# Altium schematic sheet Board3ph.SchDoc (part 2 of 2)
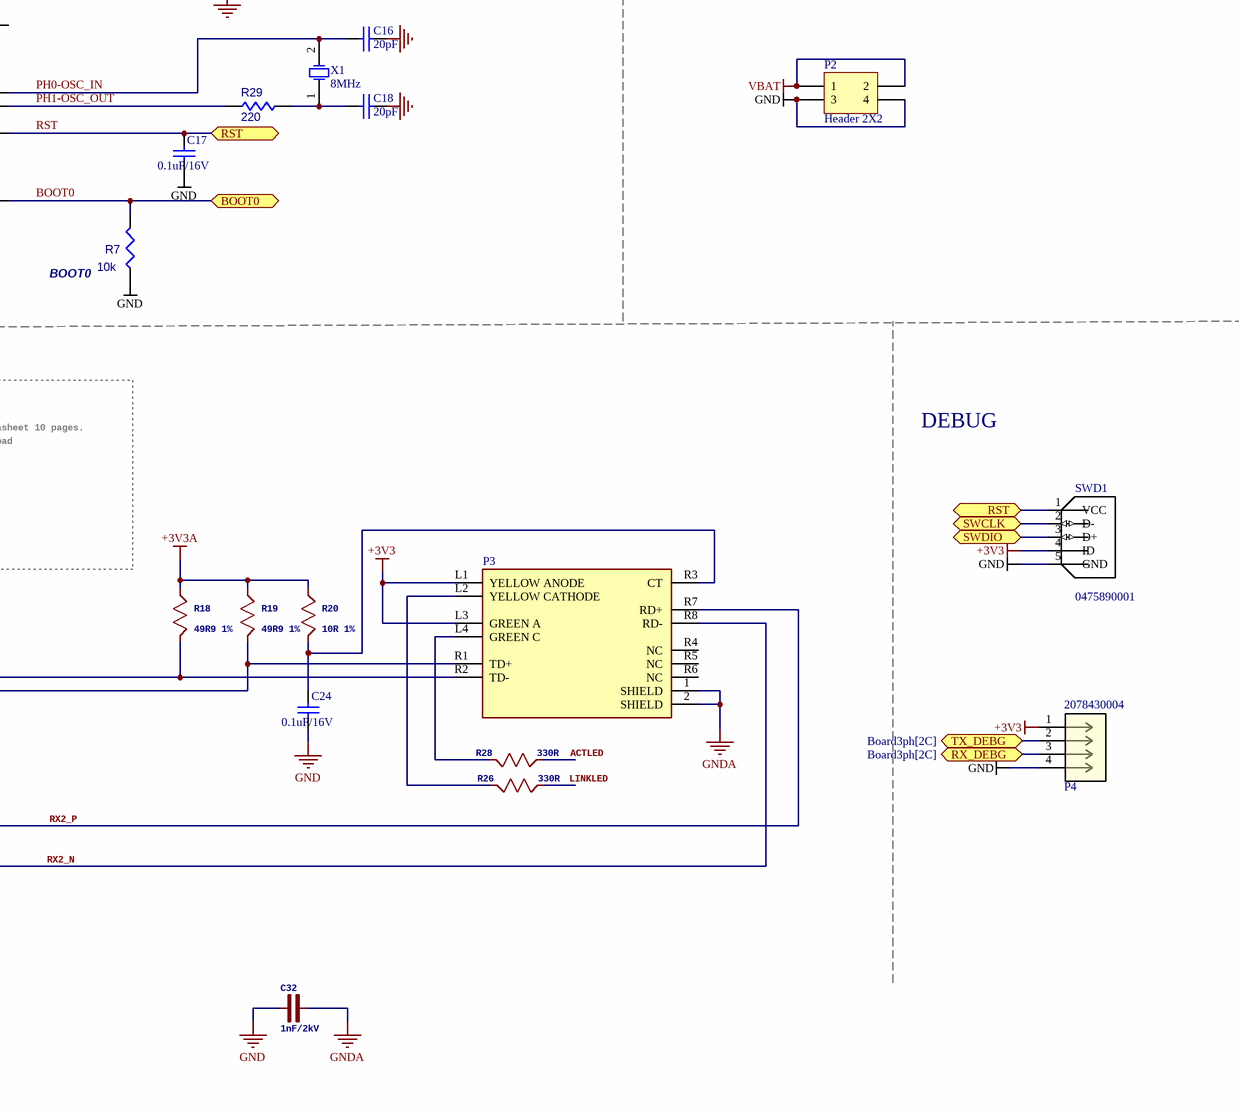
[diagram p4: Board3ph.SchDoc, bottom right]

## Library data of the parts
C1 = TAJC686K016RNJ: CAP TANT 68UF 10% 16V 2312; Manufacturer: Kyocera AVX; Item Type: Capacitors; Dielectric Material: Tantalum; ESR (Equivalent Series Resistance): 1.3R; Voltage Rating (DC): 16.3V; Leakage Current: 10.9uA; Polarity: Polar; Dissipation Factor: 6%; Supplier: Digikey; LCSC Part Number: C7220; Manufacturer Part Number: TAJC686K016RNJ; RoHS: Yes; Stock: 888; Pricing: 1=1.06, 10=0.729, 50=0.581, 100=0.5317 (USD); Mounting Technology: Surface Mount; Case/Package: Molded; Pins: 2; Case Code (Imperial): 2312; Case Code (Metric): 6032; Min Operating Temperature: -55°C; Max Operating Temperature: 125°C; Value: 68uF; Tolerance: 10%; Packaging: Tape and Reel; Voltage Rating: 16V; Package Quantity: 1; Termination: SMD/SMT; Voltage: 16V; Features: General Purpose; Series: TAJ; Length: 6mm; Width: 3.2mm; Height: 2.6mm; Height - Seated (Max): 0.11inch; Depth: 3.2mm; Radiation Hardening: No; Reach SVHC Compliant: No; Lead Free: Lead Free; RoHS Compliant: Yes; ComponentLink1URL: https://datasheet.ciiva.com/11794/0900766b802e69d0-11794413.pdf?src-supplier=Rs; ComponentLink1Description: https://datasheet.ciiva.com/11794/0900766b802e69d0-11794413.pdf?src-supplier=Rs; ComponentLink2URL: https://datasheet.ciiva.com/7864/1680476-7864538.pdf?src-supplier=Element14; ComponentLink2Description: https://datasheet.ciiva.com/7864/1680476-7864538.pdf?src-supplier=Element14; ComponentLink3URL: https://datasheet.ciiva.com/7864/1680476-7864539.pdf?src-supplier=Element14; ComponentLink3Description: https://datasheet.ciiva.com/7864/1680476-7864539.pdf?src-supplier=Element14; ComponentLink4URL: https://datasheet.ciiva.com/7864/1680476-7864537.pdf?src-supplier=Element14; ComponentLink4Description: https://datasheet.ciiva.com/7864/1680476-7864537.pdf?src-supplier=Element14; ComponentLink5URL: https://datasheet.ciiva.com/28577/taj-28577855.pdf?src-supplier=Element14; ComponentLink5Description: https://datasheet.ciiva.com/28577/taj-28577855.pdf?src-supplier=Element14; ComponentLink6URL: https://datasheet.ciiva.com/264/taj-264443.pdf?src-supplier=Digikey; ComponentLink6Description: https://datasheet.ciiva.com/264/taj-264443.pdf?src-supplier=Digikey; ComponentLink7URL: https://datasheet.ciiva.com/264/taj-264442.pdf?src-supplier=Digikey; ComponentLink7Description: https://datasheet.ciiva.com/264/taj-264442.pdf?src-supplier=Digikey; ComponentLink8URL: https://datasheet.ciiva.com/264/taj-264444.pdf?src-supplier=Digikey; ComponentLink8Description: https://datasheet.ciiva.com/264/taj-264444.pdf?src-supplier=Digikey; ComponentLink9URL: https://datasheet.ciiva.com/12883/taj-27497-12883640.pdf?src-supplier=Mouser; ComponentLink9Description: https://datasheet.ciiva.com/12883/taj-27497-12883640.pdf?src-supplier=Mouser; ComponentLink10URL: https://datasheet.ciiva.com/11225/taj-11225965.pdf?src-supplier=Avnet; ComponentLink10Description: https://datasheet.ciiva.com/11225/taj-11225965.pdf?src-supplier=Avnet; ComponentLink11URL: https://datasheet.ciiva.com/16298/taj-16298458.pdf?src-supplier=Future+Electronics; ComponentLink11Description: https://datasheet.ciiva.com/16298/taj-16298458.pdf?src-supplier=Future+Electronics; ComponentLink12URL: https://datasheet.ciiva.com/15163/getdatasheetpartid-41779-15163003.pdf?src-supplier=Verical; ComponentLink12Description: https://datasheet.ciiva.com/15163/getdatasheetpartid-41779-15163003.pdf?src-supplier=Verical
C2 C6-C9 C11 C14 C17 C19-C24 = Cap: CAPACITOR 0603 CERAMIC; Manufacturer: Samsung; Manufacturer Part Number: CL10F104ZO8NNNC; Value: 100nF; Voltage Rating: 16V; Revision: July-2002: Re-released for DXP Platform.; Supplier 1: Digi-Key; Supplier Part Number 1: 1276-1258-1-ND; Capacitance: 100nF; Case Code (Metric): 1608; Category: Ceramic Capacitors
C3 C4 = C-3216(TANTAL): CAP TANT 10UF 10% 10V 1206  (3216); Manufacturer: Kyocera AVX; Manufacturer Part Number: TAJA106K006RNJ; Tolerance: 20%; Voltage: 6.3V; ComponentLink1Description: supplier; ComponentLink1URL: https://www.digikey.com/product-detail/en/avx-corporation/TAJA106K010RNJ/478-1654-1-ND/564686; Supplier 1: Digi-Key; Supplier Part Number 1: 478-1653-1-ND; Capacitance: 10uF; Case Code (Metric): 3216; Category: Tantalum Capacitors
C5 = Cap Pol1: Polarized Capacitor  1uF/16V TANTAL 0805; Manufacturer: Kyocera AVX; Manufacturer Part Number: F921C105MPA; Value: 1uF; Tolerance: 20%; Voltage Rating: 16V; Published: 8-Jun-2000; Revision: July-2002: Re-released for DXP Platform.; Publisher: Altium Limited; Supplier 1: Digi-Key; Supplier Part Number 1: 478-8126-1-ND; Case Code (Metric): 2012; Category: Tantalum Capacitors; Supplier Unit Price 1: $0.09899
C10 C38 = CAP: Capacitor 1uF 6.3V X5R 10% SMD 0603; Manufacturer: Samsung; Manufacturer Part Number: CL10A105KQ8NNNC; Value: 1uF; Supplier 1: Digi-Key; Supplier Part Number 1: 1276-1036-1-ND; Case Code (Metric): 1608; Category: Ceramic Capacitors; Dielectric: X5R; Tolerance: 10%; Voltage Rating: 6.3V; Supplier Unit Price 1: $0.00877
C12 C13 = 0805C-18PF-50V-C0G-JOH: Tantalum Capacitors - Solid SMD 10V 22uF 20%  3216 -1206; Manufacturer: Kyocera AVX; Manufacturer Part Number: TAJA226M010RNJ; Leakage Current: 2.2uA; Supplier 1: Digi-Key; Supplier Part Number 1: 478-5798-1-ND; Case Code (Metric): 3216; Category: Tantalum Capacitors
C15 C43 C44 C46 = CL10F104ZO8NNNC: Multilayer Ceramic Capacitor, 0.1 uF, 16 V, -20, +80%, Y5V, 0603 [1608 Metric]; Manufacturer: Samsung; Material: 4241ConductorMaterial; Voltage Rating (DC): 16V; Supplier: Digikey; Supplier Part Number: 1276-1258-1-ND; Manufacturer Part Number: CL10F104ZO8NNNC; RoHS: Yes; Category: Ceramic Capacitors; Stock: 2033375; Pricing: 1=0.1, 10=0.027, 50=0.018, 100=0.0153, 500=0.01076, 1000=0.00938 (USD); ComponentLink1URL: https://datasheet.ciiva.com/16199/cl10f104zo8nnnc-16199254.pdf?src-supplier=Future+Electronics; ComponentLink1Description: https://datasheet.ciiva.com/16199/cl10f104zo8nnnc-16199254.pdf?src-supplier=Future+Electronics; ComponentLink2URL: https://datasheet.ciiva.com/25805/cl10f104zo8nnnc-25805810.pdf?src-supplier=Digikey; ComponentLink2Description: https://datasheet.ciiva.com/25805/cl10f104zo8nnnc-25805810.pdf?src-supplier=Digikey; LCSC Part Number: C2762283
C16 C18 = CAP: Capacitor 20p 50v 0603; Manufacturer: Samsung; Manufacturer Part Number: CL10C200JB8NNNC; Temperature Coefficient: 300ppm/°C; Tolerance: 5%; Value: 20pF; Supplier 1: Digi-Key; Supplier Part Number 1: 1276-1187-1-ND; Capacitance: 20pF; Case Code (Metric): 1608; Category: Ceramic Capacitors; Voltage: 50V; Supplier Unit Price 1: $0.0134
C25 C37 = C-3216(TANTAL): CAP TANT 10UF 10% 10V 1206  (3216); Manufacturer: Kyocera AVX; Manufacturer Part Number: TAJA106K010RNJ; ESR (Equivalent Series Resistance): 3R; ComponentLink1Description: supplier; ComponentLink1URL: https://www.digikey.com/product-detail/en/avx-corporation/TAJA106K010RNJ/478-1654-1-ND/564686; Supplier 1: Digi-Key; Supplier Part Number 1: 478-1654-1-ND; Capacitance: 10uF; Case Code (Metric): 3216; Category: Tantalum Capacitors; Tolerance: 10%; Voltage: 10V
C26 C31 C34 = C-1608: Multilayer Ceramic Capacitors MLCC - SMD/SMT 16V 0.01uF 0603 X8R 5%; Manufacturer: KEMET; Manufacturer Part Number: C0603X103J4HACTU; Supplier 1: Mouser; Supplier Part Number 1: 80-C0603X103J4HACTU; Supplier Unit Price 1: $0.024
C27 C30 = C-1608: 6800pF ±10% 200V Ceramic Capacitor X7R 0603 (1608 Metric); Manufacturer: KEMET; Manufacturer Part Number: C0603C682K2RECAUTO; Capacitance: 6.8nF; Supplier 1: Digi-Key; Supplier Part Number 1: 399-14765-1-ND; Case Code (Metric): 1608; Category: Ceramic Capacitors; Tolerance: 10%; Supplier Unit Price 1: $0.05209
C28 C29 = C-1608: 18pF ±5% 50V Ceramic Capacitor C0G, NP0 0603 (1608 Metric); Manufacturer: Samsung; Manufacturer Part Number: CL10C180JB8NNNC; Temperature Coefficient: 300ppm/°C; Supplier 1: Digi-Key; Supplier Part Number 1: 1276-1089-1-ND; Capacitance: 18pF; Case Code (Metric): 1608; Category: Ceramic Capacitors; Mount: Surface Mount; Tolerance: 5%; Supplier Unit Price 1: $0.01549
C32 = C-4520: 1000pF ±10% 1000V (1kV) Ceramic Capacitor X7R 0805 (2012 Metric); Manufacturer: KEMET; Manufacturer Part Number: C0805C102KDRACAUTO; Capacitance: 1nF; Supplier 1: Digi-Key; Supplier Part Number 1: 399-16643-1-ND; Case/Package: 0805; Category: Capacitors; Tolerance: 10%; Voltage Rating: 1kV; Supplier Unit Price 1: $0.13364
C33 = C-2012: CAP CER 4,7UF 10V X5R 0603; Tolerance: 10%; Voltage Rating: 25V; Capacitance: 4.7uF; Case Code (Imperial): 0603; Category: Ceramic Capacitors; Dielectric: X5R; Supplier Unit Price 1: $0.05773
C35 C36 = 0603C: CAPACITOR 0603 CERAMIC  9p 50V; Manufacturer Part Number: CGA3E2NP01H090D080AA; Manufacturer: TDK; Capacitance: 9pF; Dielectric: C0G; Case Code (Imperial): 0603; Case Code (Metric): 1608; Category: Ceramic Capacitors; Features: High Temperature; Resistor Type: Ceramic; Ratings: AEC-Q200; Supplier 1: Digi-Key; Supplier Part Number 1: 445-12433-1-ND; Supplier Unit Price 1: $0.20
C39 C47 = TAJA106K010RNJ: CAP TANT 10UF 10% 10V 1206; Manufacturer: Kyocera AVX; Dielectric Material: 5684ConductorMaterial; Life (Hours): 2000Hour; Ripple Current: 158mA; Q Factor: 6NUMBER; Supplier: Digikey; Supplier Part Number: 478-1654-1-ND; Manufacturer Part Number: TAJA106K010RNJ; RoHS: Yes; Category: Tantalum Capacitors; Stock: 171123; Pricing: 1=0.37, 10=0.219, 50=0.158, 100=0.139, 500=0.10666, 1000=0.09657 (USD); Voltage Rating (AC): 10V; Lead Free: 5697LeadFree; ComponentLink1URL: https://datasheet.ciiva.com/11793/0900766b80ccdc61-11793042.pdf?src-supplier=Rs; ComponentLink1Description: https://datasheet.ciiva.com/11793/0900766b80ccdc61-11793042.pdf?src-supplier=Rs; ComponentLink2URL: https://datasheet.ciiva.com/7730/1826076-7730709.pdf?src-supplier=Element14; ComponentLink2Description: https://datasheet.ciiva.com/7730/1826076-7730709.pdf?src-supplier=Element14; ComponentLink3URL: https://datasheet.ciiva.com/7730/1703059-7730710.pdf?src-supplier=Element14; ComponentLink3Description: https://datasheet.ciiva.com/7730/1703059-7730710.pdf?src-supplier=Element14; ComponentLink4URL: https://datasheet.ciiva.com/7730/1826076-7730711.pdf?src-supplier=Element14; ComponentLink4Description: https://datasheet.ciiva.com/7730/1826076-7730711.pdf?src-supplier=Element14; ComponentLink5URL: https://datasheet.ciiva.com/14593/70001050-14593951.pdf?src-supplier=Allied+Electronics; ComponentLink5Description: https://datasheet.ciiva.com/14593/70001050-14593951.pdf?src-supplier=Allied+Electronics; ComponentLink6URL: https://datasheet.ciiva.com/3004/taj-3004385.pdf?src-supplier=Avnet; ComponentLink6Description: https://datasheet.ciiva.com/3004/taj-3004385.pdf?src-supplier=Avnet; ComponentLink7URL: https://datasheet.ciiva.com/3004/taj-3004386.pdf?src-supplier=Avnet; ComponentLink7Description: https://datasheet.ciiva.com/3004/taj-3004386.pdf?src-supplier=Avnet; ComponentLink8URL: https://datasheet.ciiva.com/5936/2613-5936824.pdf?src-supplier=Farnell; ComponentLink8Description: https://datasheet.ciiva.com/5936/2613-5936824.pdf?src-supplier=Farnell; ComponentLink9URL: https://datasheet.ciiva.com/12882/taj-27497-12882583.pdf?src-supplier=Mouser; ComponentLink9Description: https://datasheet.ciiva.com/12882/taj-27497-12882583.pdf?src-supplier=Mouser; ComponentLink10URL: https://datasheet.ciiva.com/263/taj-263394.pdf?src-supplier=Digikey; ComponentLink10Description: https://datasheet.ciiva.com/263/taj-263394.pdf?src-supplier=Digikey; ComponentLink11URL: https://datasheet.ciiva.com/263/taj-263395.pdf?src-supplier=Digikey; ComponentLink11Description: https://datasheet.ciiva.com/263/taj-263395.pdf?src-supplier=Digikey; ComponentLink12URL: https://datasheet.ciiva.com/263/taj-263396.pdf?src-supplier=Digikey; ComponentLink12Description: https://datasheet.ciiva.com/263/taj-263396.pdf?src-supplier=Digikey; LCSC Part No:: C7177
C40 = EMK212B7225KGHT: CAP CER 2.2UF 16V X7R 0805; Manufacturer: Taiyo Yuden; Item Type: Capacitors; Material: 4241ConductorMaterial; Supplier: Digikey; LCSC Part Number: C385899; Manufacturer Part Number: EMK212B7225KGHT; RoHS: Yes; Stock: 8236; Pricing: 1=0.24, 10=0.137, 50=0.097, 100=0.0847, 500=0.06374, 1000=0.05721 (USD); Lead Free: 5697LeadFree; Halogen Free: 5694HalogenFree; ComponentLink1URL: http://www.mouser.com/ds/2/396/mlcc11_hq_e-541564.pdf?src-supplier=Mouser; ComponentLink1Description: http://www.mouser.com/ds/2/396/mlcc11_hq_e-541564.pdf?src-supplier=Mouser; ComponentLink2URL: https://datasheet.octopart.com/EMK212B7225KGHT-Taiyo-Yuden-datasheet-152732874.pdf?src-supplier=Newark; ComponentLink2Description: https://datasheet.octopart.com/EMK212B7225KGHT-Taiyo-Yuden-datasheet-152732874.pdf?src-supplier=Newark; ComponentLink3URL: https://datasheet.octopart.com/EMK212B7225KGHT-Taiyo-Yuden-datasheet-97186030.pdf?src-supplier=Future+Electronics; ComponentLink3Description: https://datasheet.octopart.com/EMK212B7225KGHT-Taiyo-Yuden-datasheet-97186030.pdf?src-supplier=Future+Electronics; ComponentLink4URL: https://ds.yuden.co.jp/TYCOMPAS/ut/detail?pn=EMK212B7225KGHT  &amp;u=M&src-supplier=Digikey; ComponentLink4Description: https://ds.yuden.co.jp/TYCOMPAS/ut/detail?pn=EMK212B7225KGHT  &amp;u=M&src-supplier=Digikey; ComponentLink5URL: http://www.yuden.co.jp/productdata/catalog/en/mlcc01_hq_e.pdf?src-supplier=Digikey; ComponentLink5Description: http://www.yuden.co.jp/productdata/catalog/en/mlcc01_hq_e.pdf?src-supplier=Digikey; ComponentLink6URL: http://www.yuden.co.jp/ut/product/category/capacitor/putpdf/EMK212B7225KGHT.pdf?src-supplier=Avnet; ComponentLink6Description: http://www.yuden.co.jp/ut/product/category/capacitor/putpdf/EMK212B7225KGHT.pdf?src-supplier=Avnet; ComponentLink7URL: https://datasheet.octopart.com/EMK212B7225KGHT-Taiyo-Yuden-datasheet-154808297.pdf?src-supplier=Master+Electronics; ComponentLink7Description: https://datasheet.octopart.com/EMK212B7225KGHT-Taiyo-Yuden-datasheet-154808297.pdf?src-supplier=Master+Electronics
C41 C42 = EMK325ABJ107MM-P: CAP CER 100UF 16V X5R 1210; Manufacturer: Taiyo Yuden; Tolerance: 20%; Item Type: Capacitor; Supplier 1: Digi-Key; Manufacturer Part Number: EMK325ABJ107MM-P; RoHS: Yes; Category: Ceramic Capacitors; Stock 1: 81344; Pricing 1: 1=1.75, 10=1.415, 50=1.2352, 100=1.0809, 500=0.82352 (USD); Mounting Technology: Surface Mount; Case/Package: 1210; Case Code (Imperial): 1210; Case Code (Metric): 3225; Min Operating Temperature: -55°C; Max Operating Temperature: 85°C; Packaging: Cut Tape; Value: 100uF; Voltage Rating: 16V; Series: M; Lead Free: Lead Free; RoHS Compliant: Yes; ComponentLink1URL: http://ds.yuden.co.jp/TYCOMPAS/ut/detail.do?productNo=EMK325ABJ107MM-P&fileName=EMK325ABJ107MM-P_SS&mode=specSheetDownload&src-supplier=Digi-Key; ComponentLink1Description: http://ds.yuden.co.jp/TYCOMPAS/ut/detail.do?productNo=EMK325ABJ107MM-P&fileName=EMK325ABJ107MM-P_SS&mode=specSheetDownload&src-supplier=Digi-Key; Supplier Part Number 1: 587-5426-1-ND; LCSC Part Number: C90143
C45 C49 = DGH256Q2R7: CAPACITOR 25F -10%, +30% 2.7V TH; Manufacturer: CDE Illinois Capacitor; Supplier: Arrow Electronics; Supplier Part Number: DGH256Q2R7; Manufacturer Part Number: DGH256Q2R7; RoHS: Yes; Item Type: Capacitor; Pricing: 100=3.433, 4500=1.646 (USD); ComponentLink1URL: https://www.cde.com/resources/catalogs/DGH-series.pdf?src-supplier=Digikey; ComponentLink1Description: https://www.cde.com/resources/catalogs/DGH-series.pdf?src-supplier=Digikey
C48 = CC0402KRX7R8BB102: CAP CER 1000PF 25V X7R 0402; Manufacturer: Yageo; Tolerance: 10%; Dissipation Factor: 2.5%; Insulation Resistance: 10GR; Item Type: Capacitor; Supplier 1: Arrow Electronics; Manufacturer Part Number: CC0402KRX7R8BB102; RoHS: Yes; Category: Ceramic Capacitors; Stock 1: 370000; Pricing 1: 1=0.00230, 10000=0.00230, 100001=0.00190 (USD); Mount: Surface Mount; Case/Package: 0402; Number of Pins: 2; Case Code (Imperial): 0402; Case Code (Metric): 1005; Min Operating Temperature: -55°C; Max Operating Temperature: 125°C; Capacitance: 1nF; Packaging: Tape and Reel; Voltage Rating: 25V; Dielectric: X7R; Termination: SMD/SMT; Voltage Rating (DC): 25V; Series: CC; Length: 1mm; Width: 0.02inch; Thickness: 0.022inch; Depth: 0.5mm; Radiation Hardening: No; Lead Free: Lead Free; Halogen Free: Halogen Free; RoHS Compliant: Yes; ComponentLink1URL: https://datasheet.ciiva.com/26862/getdatasheetpartid-639817-26862638.pdf?src-supplier=Verical; ComponentLink1Description: https://datasheet.ciiva.com/26862/getdatasheetpartid-639817-26862638.pdf?src-supplier=Verical; ComponentLink2URL: https://datasheet.ciiva.com/5425/upy-gp-np0-16v-to-50v-8-3714-5425527.pdf?src-supplier=Mouser; ComponentLink2Description: https://datasheet.ciiva.com/5425/upy-gp-np0-16v-to-50v-8-3714-5425527.pdf?src-supplier=Mouser; Supplier Part Number 1: CC0402KRX7R8BB102; LCSC Part Number: C541372
J1 J3 = SFMC-102-X1-XX-D: Socket Strip, Cuttable, Double Row, 0.050"x0.050" Pitch; MANUFACTURER: SAMTEC; PCB DECAL: SFMC-104-X1-XX-D; System: Connector; CREATED: JUNE 03,  2014 - WENDY XIN
J2 = SFMC-104-X1-XX-D: Socket Strip, Cuttable, Double Row, 0.050"x0.050" Pitch; MANUFACTURER: SAMTEC; System: Connector; CREATED: JUNE 03,  2014 - WENDY XIN; PCB DECAL: SFMC-104-X1-XX-D
L1 = L-1608: FIXED IND 1.5UH 625MA 150 MOHM; Manufacturer: TDK; Shielding: Shielded; Tolerance: 20%; Supplier 1: Digi-Key; Supplier Part Number 1: 445-6152-1-ND; Case Code (Metric): 1608; Category: Fixed Inductors; Composition: Wirewound; Current Rating: 625mA; Manufacturer Part Number: GLFR1608T1R5M-LR; Termination: SMD/SMT; Supplier Unit Price 1: $0.10971
L2 = Inductor: FERRITE BEAD 30 OHM 0603 1LN; Manufacturer: TDK; Manufacturer Part Number: MPZ1608S300ATAH0; Impedance: 30R; Tolerance: 25%; Test Frequency: 100MHz; Supplier 1: Digi-Key; Supplier Part Number 1: 445-1562-1-ND; Case Code (Metric): 1608; Category: Ferrite Beads and Chips
L3 = MS0650-2R2M-C: 9.5A 2.2uH ±20% 16A SMD,7.15x6.6x5mm Power Inductors ROHS; Manufacturer: COILMX; Manufacturer Part Number: MS0650-2R2M-C; Package: SMD,7.15x6.6x5mm; LCSC Part Number: C18199494; Item Type: Inductor; ComponentLink1Description: LCSC; ComponentLink1URL: https://www.lcsc.com/product-detail/Power-Inductors_COILMX-MS0650-2R2M-C_C18199494.html
LED1 = LED-1608: LED RED CLEAR 2SMD 1.95V, 5mA; Manufacturer Part Number: 19-217/R6C-AL1M2VY/3T; Manufacturer: Everlight; Forward Voltage: 2.2V; Supplier 1: Digi-Key; Supplier Part Number 1: 1080-1585-1-ND; Case/Package: 0603; ComponentLink1URL: https://media.digikey.com/pdf/Data%20Sheets/Everlight%20PDFs/19-217-R6C-AL1M2VY-3T.pdf?src-supplier=Digi-Key; ComponentLink1Description: https://media.digikey.com/pdf/Data%20Sheets/Everlight%20PDFs/19-217-R6C-AL1M2VY-3T.pdf?src-supplier=Digi-Key
LED2 LED3 = NCD0603Y2: yellow 0603 Light Emitting Diodes (LED) ROHS; Manufacturer: Foshan NationStar Optoelectronics; Manufacturer Part Number: NCD0603Y2; Package: 0603; LCSC Part Number: C89811; Item Type: LED; ComponentLink1Description: LCSC; ComponentLink1URL: https://www.lcsc.com/product-detail/Light-Emitting-Diodes-LED_Foshan-NationStar-Optoelectronics-NCD0603Y2_C89811.html
LED4 = NCD0603R3: RED LED 0603 Light Emitting Diodes; Manufacturer: Foshan NationStar Optoelectronics; Manufacturer Part Number: NCD0603R3; Package: 0603; Item Type: LED; LCSC Part Number: C3151730; ComponentLink1Description: LCSC; ComponentLink1URL: https://www.lcsc.com/product-detail/Light-Emitting-Diodes-LED_Foshan-NationStar-Optoelectronics-NCD0603R3_C3151730.html
P1 = Header 3X2: CONN HDR 6POS 0.05 STACK T/H Dual row; Manufacturer: Samtec; Manufacturer Part Number: FW-03-04-L-D-200-100; System: Connector; Supplier 1: Samtec; Supplier Part Number 1: FW-03-04-L-D-200-100; Mount: TH
P2 = Header 2X2: CONN HDR 4POS 0.05 STACK T/H Dual row; Manufacturer: Samtec; Manufacturer Part Number: FW-02-04-L-D-200-100; System: Connector; Supplier 1: Samtec; Supplier Part Number 1: FW-02-04-L-D-200-100; Mount: TH
P3 = Conn_WIZnet_RB1-125BAG1A_eec: CONN MAGJACK 1PORT 100 BASE-T; ComponentLink2Description: Datasheet; Temperature: 0°C to +70°C; Supplier 2: Mouser; Supplier 1: Digi-Key; ComponentLink1URL: https://upverter.com/upn/revision/a90ddcab053b3c09/; Supplier Part Number 2: 950-RB1-125BAG1A; Supplier Part Number 1: 1278-1011-ND; ComponentLink1Description: Upverter; ComponentLink2URL: http://www.shopwiznet.com/lanotattachments/download/file/id/95/store/1/; RoHS: TRUE; Temperature Range Low: 0°C; Temperature Range High: +70°C
P4 = 2078430004: Connector Header Through Hole 4 position 0.098" (2.50mm); Manufacturer: Molex; Manufacturer Part Number: 207843-0004; Supplier 1: Digi-Key; Supplier Part Number 1: 900-2078430004-ND; Supplier Packaging 1: Tray; Supplier Unit Price 1: $0.43
Q1 = 2N7002: MOSFET N-CH 60V 115MA SOT23-3; Manufacturer_Name: Diodes Inc.; Manufacturer_Part_Number: DMN65D8L-7; Datasheet Link: https://www.diodes.com/assets/Datasheets/DMN65D8L.pdf; Height: 1mm; Mouser Part Number: 621-DMN65D8L-7; Supplier 1: Digi-Key; Supplier Part Number 1: 2N7002E-T1-E3CT-ND
Q2 Q3 = SIS488DN-T1-GE3: MOSFET N-CH 40V 40A PPAK1212-8; Manufacturer: Vishay Semiconductors; Item Type: MOSFETs; Supplier: Arrow Electronics; LCSC Part Number: C511037; Manufacturer Part Number: SIS488DN-T1-GE3; RoHS: Yes; Stock: 2575; Pricing: 1=1.0926, 10=1.0325, 25=0.9922, 50=0.9525, 100=0.9137, 250=0.9045, 500=0.8952, 1000=0.8863 (USD); ComponentLink1URL: https://datasheet.ciiva.com/24101/sis488dn-267694-24101036.pdf?src-supplier=Mouser; ComponentLink1Description: https://datasheet.ciiva.com/24101/sis488dn-267694-24101036.pdf?src-supplier=Mouser; ComponentLink2URL: https://datasheet.ciiva.com/29742/sis488dn-29742161.pdf?src-supplier=Digikey; ComponentLink2Description: https://datasheet.ciiva.com/29742/sis488dn-29742161.pdf?src-supplier=Digikey
R1 = R-1608: 0 Ohms Jumper 0.1W, 1/10W Chip Resistor 0603 (1608 Metric) Moisture Resistant Thick Film; Manufacturer Part Number: RC0603JR-070RL; Manufacturer: Yageo; Power Rating: 100mW; Temperature Coefficient: 200ppm/°C; Tolerance: 1%; Voltage Rating: 50V; Supplier 1: Digi-Key; Supplier Part Number 1: 311-0.0GRDKR-ND; Case Code (Metric): 1608; Category: Chip SMD Resistors; Composition: Thick Film; Supplier Unit Price 1: $0.00347
R2 = 22K Ohm 0.5% 1/16W 0603: RES SMD 22K OHM 0.5% 1/16W 0603; Manufacturer: Susumu; Manufacturer Part Number: RR0816P-223-D; Max Power Dissipation: 63mW; Resistance: 22kR; Power Rating: 62.5mW; Temperature Coefficient: 25ppm/°C; Voltage Rating: 75V; Case Code (Metric): 1608; Category: Chip SMD Resistors; Tolerance: 0.5%; Supplier 1: Digi-Key; Supplier Part Number 1: RR08P22.0KDCT-ND; Supplier Unit Price 1: $0.01237
R3 = RES: Gen Purp Chip, R0603 0.1W 5%; Manufacturer: TE Connectivity; PartNumber: ERJ3GEYJ101V; Manufacturer Part Number: CRGCQ0603J330R; Value: 100; Component SubKind: Resistor; Voltage: 75; MetricFootprint: R1608MM; Max Power Dissipation: 100mW; Temperature Coefficient: 100ppm/°C; Material: Thick-Film; Watts: 0.1W; RoHS: Yes; Published: 7/16/2009; Publisher: AltiumDBManager1.1; Component Type: Standard; Pin Count: 2; Supplier 1: Digi-Key; Supplier Part Number 1: A130088CT-ND; Case Code (Metric): 1608; Composition: Thick Film; Resistance: 330R; ComponentLink1URL: https://www.te.com/commerce/DocumentDelivery/DDEController?Action=srchrtrv&amp;DocNm=1773204-3&amp;DocType=DS&amp;DocLang=English&src-supplier=Digi-Key; ComponentLink1Description: https://www.te.com/commerce/DocumentDelivery/DDEController?Action=srchrtrv&amp;DocNm=1773204-3&amp;DocType=DS&amp;DocLang=English&src-supplier=Digi-Key
R4 R6 = RES1: RES SMD 100K OHM 1% 1/4W 0603; Manufacturer: Vishay Dale; Manufacturer Part Number: RCA0603100KFKEAHP; Max Power Dissipation: 250mW; Resistance: 100kR; Temperature Coefficient: 100ppm/°C; Supplier 1: Digi-Key; Supplier Part Number 1: 541-3247-1-ND; Case Code (Metric): 1608; Composition: Thick Film; Tolerance: 1%; Supplier Unit Price 1: $0.03376; ComponentLink1URL: http://www.vishay.com/docs/20067/rcahp.pdf?src-supplier=Digi-Key; ComponentLink1Description: http://www.vishay.com/docs/20067/rcahp.pdf?src-supplier=Digi-Key
R5 = RES1: RES SMD 715K OHM 1% 1/10W 0603; Manufacturer: Yageo; Manufacturer Part Number: RC0603FR-07402KL; Max Power Dissipation: 100mW; Resistance: 402kR; Temperature Coefficient: 100ppm/°C; Voltage Rating (DC): 50V; Case Code (Metric): 1608; Category: Chip SMD Resistors; Resistor Type: Thick Film; Size Code: 0603; Tolerance: 1%; Supplier 1: Digi-Key; Supplier Part Number 1: 311-402KHRCT-ND; Supplier Unit Price 1: $0.10
R7-R17 R21 R27 = RES1: RES SMD 10K OHM 0.5% 1/16W 0603; Manufacturer: Susumu; Manufacturer Part Number: RR0816P-103-D; Max Power Dissipation: 63mW; Resistance: 10kR; Supplier 1: Digi-Key; Supplier Part Number 1: RR08P10.0KDCT-ND; Case Code (Metric): 1608; Category: Chip SMD Resistors; Termination: SMD/SMT; Tolerance: 0.5%; Supplier Unit Price 1: $0.0136
R18 R19 R24 R25 = R-1608: RES SMD 49.9 OHM 1% 1/10W 0603; Manufacturer: Yageo; Manufacturer Part Number: RC0603FR-0749R9L; Power Rating: 100mW; Resistance: 49.9R; Temperature Coefficient: 100ppm/°C; Voltage Rating: 50V; Supplier 1: Digi-Key; Supplier Part Number 1: 311-49.9HRDKR-ND; Case Code (Metric): 1608; Category: Chip SMD Resistors; Tolerance: 1%; Supplier Unit Price 1: $0.00366
R20 = R-1608: RES SMD 10 OHM 1% 1/10W 0603; Manufacturer Part Number: RC0603FR-0710RL; Manufacturer: Yageo; Temperature Coefficient: 200ppm/°C; Supplier 1: Digi-Key; Supplier Part Number 1: 311-10.0HRCT-ND; Case Code (Metric): 1608; Category: Chip SMD Resistors; Resistance: 10R; Tolerance: 1%; Supplier Unit Price 1: $0.00729
R22 = R-1608: Resistor CRGCQ 0603 1M0 5%; Manufacturer: TE Connectivity; Manufacturer Part Number: CRGCQ0603J1M0; Max Power Dissipation: 100mW; Temperature Coefficient: 100ppm/°C; Resistance: 1MR; Supplier 1: Digi-Key; Supplier Part Number 1: A130109CT-ND; Case Code (Metric): 1608; Composition: Thick Film; Tolerance: 5%; Supplier Unit Price 1: $0.00336
R23 = R-1608: RESISTOR 0603 12.4K 1%; Supplier 1: Digi-Key; Supplier Part Number 1: P12.4KHCT-ND
R26 R28 = R-1608: 330 Ohms ±5% 0.1W, 1/10W Chip Resistor 0603; Manufacturer: TE Connectivity; Manufacturer Part Number: CRGCQ0603J330R; Max Power Dissipation: 100mW; Supplier 1: Digi-Key; Supplier Part Number 1: A130088CT-ND; Case Code (Metric): 1608; Composition: Thick Film; Tolerance: 5%; Supplier Unit Price 1: $0.00336
R29 = RES: 220 Ohms ±1% 0.1W, 1/10W Chip Resistor 0603 (1608 Metric) Moisture Resistant Thick Film; Manufacturer: Yageo; Manufacturer Part Number: RC0603FR-07220RL; Max Power Dissipation: 100mW; Voltage Rating: 50V; Supplier 1: Digi-Key; Supplier Part Number 1: 311-220HRCT-ND; Case Code (Metric): 1608; Category: Chip SMD Resistors; Tolerance: 1%; Supplier Unit Price 1: $0.00366
R30 = PRL0816-R010-F-T1: Current Sense Resistors - SMD 1/3W 0.01ohm 1%; Manufacturer: Susumu; Supplier: Mouser; Supplier Part Number: 754-PRL0816-R010-FT1; Manufacturer Part Number: PRL0816-R010-F-T1; RoHS: Yes; Item Type: Resistors; Stock: 4570; Pricing: 1=0.6, 10=0.429, 50=0.429, 100=0.224, 1000=0.183, 10000=0.116 (USD); Min Operating Temperature: -40°C; Max Operating Temperature: 125°C; Lead Free: 5697LeadFree; ComponentLink1URL: http://www.mouser.com/ds/2/392/n_catalog_partition07_en-1114612.pdf?src-supplier=Mouser; ComponentLink1Description: http://www.mouser.com/ds/2/392/n_catalog_partition07_en-1114612.pdf?src-supplier=Mouser
R31 = RT0603BRE07113KL: RES SMD 113K OHM 0.1% 1/10W 0603; Manufacturer: Yageo; Item Type: Resistors; Value: 113kR; Max Power Dissipation: 100mW; Temperature Coefficient: 50ppm/°C; Voltage Rating (DC): 50V; Supplier: Digikey; LCSC Part Number: C861633; Manufacturer Part Number: RT0603BRE07113KL; RoHS: Yes; Pricing: 5000=0.04488 (USD); Case/Package: 0603; Min Operating Temperature: -55°C; Max Operating Temperature: 155°C; Packaging: Tape and Reel; Tolerance: 0.1%; Number of Terminations: 2; Series: RT; Lead Free: Lead Free; RoHS Compliant: Yes; ComponentLink1URL: https://datasheet.ciiva.com/2584/pyu-rt-1-to-0-05-rohs-l-5-2584176.pdf?src-supplier=Digikey; ComponentLink1Description: https://datasheet.ciiva.com/2584/pyu-rt-1-to-0-05-rohs-l-5-2584176.pdf?src-supplier=Digikey
R32 R33 = RES1: RES SMD 100K OHM 1% 1/4W 0603; Manufacturer: Vishay Dale; Manufacturer Part Number: RCA0603100KFKEAHP; Max Power Dissipation: 250mW; Resistance: 100kR; Supplier 1: Digi-Key; Supplier Part Number 1: 541-3247-1-ND; Case Code (Metric): 1608; Tolerance: 1%; Supplier Unit Price 1: $0.03376
R34 = 100 Ohm 5% 1/10W 0603: RES 100 OHM 5% 1/10W 0603; Manufacturer: Stackpole Electronics; Manufacturer Part Number: RMCF0603JT100R; Temperature Coefficient: 100ppm/°C; Case Code (Metric): 1608; Features: Automotive AEC-Q200; Resistance: 100R; Tolerance: 5%; Supplier 1: Digi-Key; Supplier Part Number 1: RMCF0603JT100RCT-ND; Supplier Unit Price 1: $0.00207
R35 = 4K7 Ohm 5% 1/10W 0603: RES 4.7K OHM 5% 1/10W 0603; Manufacturer: Stackpole Electronics; Manufacturer Part Number: RMCF0603JT4K70; Temperature Coefficient: 200ppm/°C; Max Power Dissipation: 100mW; Supplier 1: Digi-Key; Supplier Part Number 1: RMCF0603JT4K70CT-ND; Case Code (Imperial): 0603; Category: Chip SMD Resistors; Features: Automotive AEC-Q200; Supplier Unit Price 1: $0.00207
R36 = RC0402FR-076K2L: RES 6.2K OHM 1% 1/16W 0402; Manufacturer: Yageo; Item Type: Resistors; Voltage Rating: 50V; Power Rating: 63mW; Value: 6.2kR; Temperature Coefficient: 100ppm/°C; Supplier: Rs; LCSC Part Number: C137946; Manufacturer Part Number: RC0402FR-076K2L; RoHS: Yes; Stock: 13400; Pricing: 100=0.034, 1000=0.032, 2500=0.031, 5000=0.028, 10000=0.026 (DKK); Case/Package: 0402; Case Code (Imperial): 0402; Case Code (Metric): 1005; Min Operating Temperature: -55°C; Max Operating Temperature: 155°C; Tolerance: 1%; Packaging: Tape and Reel; Package Quantity: 1; Termination: SMD/SMT; Resistor Type: Thick Film; Number of Terminations: 2; Max Power Dissipation: 63mW; Voltage Rating (DC): 50V; Features: Moisture Resistant; Series: RC; Construction: Rectangular; Resistance Tolerance: 1%; Length: 1mm; Width: 0.02inch; Height: 0.016inch; Depth: 0.5mm; Military Standard: Not; Lead Free: Lead Free; RoHS Compliant: Yes; Reach SVHC Compliant: Unknown; ComponentLink1URL: https://datasheet.ciiva.com/7850/1018594-7850076.pdf?src-supplier=Element14; ComponentLink1Description: https://datasheet.ciiva.com/7850/1018594-7850076.pdf?src-supplier=Element14; ComponentLink2URL: https://datasheet.ciiva.com/7850/1018594-7850077.pdf?src-supplier=Element14; ComponentLink2Description: https://datasheet.ciiva.com/7850/1018594-7850077.pdf?src-supplier=Element14
R37 = RT0603BRD0738K3L: RES SMD 38.3KOHM 0.1% 1/10W 0603; Manufacturer: Yageo; Item Type: Resistor; Supplier: Arrow Electronics; LCSC Part Number: C861362; Manufacturer Part Number: RT0603BRD0738K3L; RoHS: Yes; Stock: 3002; Pricing: 1=0.0648, 10=0.0429, 25=0.0356, 100=0.0309, 250=0.0306, 500=0.0231, 1000=0.0223, 3000=0.0214 (USD); ComponentLink1URL: https://datasheet.ciiva.com/8889/pyu-rt-1-to-0-05-rohs-l-4-8889401.pdf?src-supplier=Avnet; ComponentLink1Description: https://datasheet.ciiva.com/8889/pyu-rt-1-to-0-05-rohs-l-4-8889401.pdf?src-supplier=Avnet; ComponentLink2URL: https://datasheet.ciiva.com/2585/pyu-rt-1-to-0-05-rohs-l-5-2585913.pdf?src-supplier=Digikey; ComponentLink2Description: https://datasheet.ciiva.com/2585/pyu-rt-1-to-0-05-rohs-l-5-2585913.pdf?src-supplier=Digikey
R38 R44 = AC0805FR-071M05L: RES 1.05 MOHM 1% 1/8W 0805; Manufacturer: Yageo; Supplier: Digikey; LCSC Part Number: C228592; Manufacturer Part Number: AC0805FR-071M05L; RoHS: Yes; Category: Chip SMD Resistors; Pricing: 5000=0.00714 (USD); RoHS Compliant: Yes
R39 R45 R47 R49 = RC0402FR-070RL: RES 0 OHM JUMPER 1/16W 0402; Manufacturer: Yageo; Item Type: Resistors; Tolerance: 1%; Power Rating: 62.5mW; Voltage Rating: 50V; Temperature Coefficient: 200ppm/°C; Max Power Dissipation: 63mW; Supplier 1: Mouser; Manufacturer Part Number: RC0402FR-070RL; RoHS: Yes; Stock 1: 8556842; Pricing 1: 1=0.10000, 10=0.01400, 50=0.01400, 100=0.00600, 1000=0.00300, 5000=0.00200, 10000=0.00100 (USD); Mount: Surface Mount; Case/Package: 0402; Contact Plating: Tin,Matte; Case Code (Imperial): 0402; Case Code (Metric): 1005; Size Code: 0402; Min Operating Temperature: -55°C; Max Operating Temperature: 155°C; Resistance: 0R; Resistor Type: Thick Film; Packaging: Tape and Reel; Termination: SMD/SMT; Features: Moisture Resistant; Series: RC; Number of Terminations: 2; Length: 1mm; Width: 0.5mm; Height: 0.35mm; Radiation Hardening: No; Lead Free: Lead Free; RoHS Compliant: Yes; ComponentLink1URL: https://datasheet.ciiva.com/8896/pyu-rc0402-51-rohs-l-6-8896149.pdf?src-supplier=Avnet; ComponentLink1Description: https://datasheet.ciiva.com/8896/pyu-rc0402-51-rohs-l-6-8896149.pdf?src-supplier=Avnet; ComponentLink2URL: https://datasheet.ciiva.com/16790/pyu-rc0402-51-rohs-l-6-r-16790444.pdf?src-supplier=Future+Electronics; ComponentLink2Description: https://datasheet.ciiva.com/16790/pyu-rc0402-51-rohs-l-6-r-16790444.pdf?src-supplier=Future+Electronics; Supplier Part Number 1: 603-RC0402FR-070RL; LCSC Part Number: C106231
R40-R42 = RC0402FR-071K5L: RES 1.5K OHM 1% 1/16W 0402; Manufacturer: Yageo; Resistance: 1.5kR; Power Rating: 62.5mW; Voltage Rating: 50V; Temperature Coefficient: 100ppm/°C; Max Power Dissipation: 63mW; Supplier 1: Digi-Key; Manufacturer Part Number: RC0402FR-071K5L; RoHS: Yes; Category: Chip SMD Resistors; Stock 1: 2832947; Pricing 1: 1=0.10000, 10=0.01500, 100=0.00610, 1000=0.00275, 2500=0.00239, 5000=0.00197 (USD); Case/Package: 0402; Case Code (Metric): 1005; Case Code (Imperial): 0402; Size Code: 0402; Min Operating Temperature: -55°C; Max Operating Temperature: 155°C; Resistor Type: Thick Film; Package Quantity: 1; Tolerance: 1%; Packaging: Tape and Reel; Number of Terminations: 2; Termination: SMD/SMT; Features: Moisture Resistant; Series: RC; Resistance Tolerance: 1%; Construction: Rectangular; Technology: THICK FILM; Length: 1mm; Width: 0.02inch; Height: 0.016inch; Depth: 0.5mm; RoHS Compliant: Yes; REACH SVHC: No SVHC; Military Standard: Not; Lead Free: Lead Free; ComponentLink1URL: https://datasheet.ciiva.com/11808/0900766b80c66297-11808238.pdf?src-supplier=RSComponents; ComponentLink1Description: https://datasheet.ciiva.com/11808/0900766b80c66297-11808238.pdf?src-supplier=RSComponents; ComponentLink2URL: https://datasheet.ciiva.com/46394/1018594-46394950.pdf?src-supplier=Element14; ComponentLink2Description: https://datasheet.ciiva.com/46394/1018594-46394950.pdf?src-supplier=Element14; ComponentLink3URL: https://datasheet.ciiva.com/2453/pyu-r-int-thick-7-2453440.pdf?src-supplier=Digi-Key; ComponentLink3Description: https://datasheet.ciiva.com/2453/pyu-r-int-thick-7-2453440.pdf?src-supplier=Digi-Key; ComponentLink4URL: https://datasheet.ciiva.com/2453/pyu-r-int-thick-7-2453441.pdf?src-supplier=Digi-Key; ComponentLink4Description: https://datasheet.ciiva.com/2453/pyu-r-int-thick-7-2453441.pdf?src-supplier=Digi-Key; ComponentLink5URL: https://datasheet.ciiva.com/2453/pyu-r-int-thick-7-2453439.pdf?src-supplier=Digi-Key; ComponentLink5Description: https://datasheet.ciiva.com/2453/pyu-r-int-thick-7-2453439.pdf?src-supplier=Digi-Key; ComponentLink6URL: https://datasheet.ciiva.com/12558/pyu-rc0402-51-rohs-l-6-r-8721-12558542.pdf?src-supplier=Mouser; ComponentLink6Description: https://datasheet.ciiva.com/12558/pyu-rc0402-51-rohs-l-6-r-8721-12558542.pdf?src-supplier=Mouser; ComponentLink7URL: https://datasheet.ciiva.com/7849/1018594-7849863.pdf?src-supplier=Element14; ComponentLink7Description: https://datasheet.ciiva.com/7849/1018594-7849863.pdf?src-supplier=Element14; ComponentLink8URL: https://datasheet.ciiva.com/7849/1018594-7849864.pdf?src-supplier=Element14; ComponentLink8Description: https://datasheet.ciiva.com/7849/1018594-7849864.pdf?src-supplier=Element14; ComponentLink9URL: https://datasheet.ciiva.com/15189/getdatasheetpartid-323992-15189370.pdf?src-supplier=Verical; ComponentLink9Description: https://datasheet.ciiva.com/15189/getdatasheetpartid-323992-15189370.pdf?src-supplier=Verical; Supplier Part Number 1: 311-1.50KLRCT-ND; LCSC Part Number: C114759
R43 = RT0805BRD07200KL: RES SMD 200K OHM 0.1% 1/8W 0805; Manufacturer: Yageo; Item Type: Resistors; Supplier: Rs; LCSC Part Number: C728645; Manufacturer Part Number: RT0805BRD07200KL; RoHS: Yes; Stock: 2060; Pricing: 10=0.242, 100=0.471, 250=0.396, 500=0.322, 1000=0.262 (DKK); ComponentLink1URL: https://datasheet.ciiva.com/8886/pyu-rt-1-to-0-05-rohs-l-4-8886959.pdf?src-supplier=Avnet; ComponentLink1Description: https://datasheet.ciiva.com/8886/pyu-rt-1-to-0-05-rohs-l-4-8886959.pdf?src-supplier=Avnet; ComponentLink2URL: https://datasheet.ciiva.com/2584/pyu-rt-1-to-0-05-rohs-l-5-2584830.pdf?src-supplier=Digikey; ComponentLink2Description: https://datasheet.ciiva.com/2584/pyu-rt-1-to-0-05-rohs-l-5-2584830.pdf?src-supplier=Digikey
R46 = RC0603FR-071M5L: RES SMD 1.5M Ohm 1% 0.1W(1/10W)  0603; Manufacturer: Yageo; Power Rating: 100mW; Resistance: 1.5MR; Voltage Rating: 75V; Voltage Rating (DC): 50V; Temperature Coefficient: 100ppm/°C; Supplier 1: Digi-Key; Manufacturer Part Number: RC0603FR-071M5L; RoHS: Yes; Category: Chip SMD Resistors; Stock 1: 211390; Pricing 1: 1=0.10000, 10=0.02400, 100=0.00970, 1000=0.00436, 2500=0.00378 (USD); Case/Package: 0603; Number of Pins: 2; Case Code (Imperial): 0603; Case Code (Metric): 1608; Weight: 7.1E-05oz; Size Code: 0603; Min Operating Temperature: -55°C; Max Operating Temperature: 155°C; Resistor Type: Thick Film; Tolerance: 1%; Packaging: Tape and Reel; Termination: SMD/SMT; Features: Moisture Resistant; Series: RC; Max Power Dissipation: 100mW; Number of Terminations: 2; Construction: Rectangular; Resistance Tolerance: 1%; Technology: THICK FILM; Length: 1.6mm; Width: 0.8mm; Height: 0.45mm; Depth: 0.8mm; RoHS Compliant: Yes; REACH SVHC: No SVHC; Military Standard: Not; Lead Free: Lead Free; ComponentLink1URL: https://datasheet.ciiva.com/11819/0900766b80f96399-11819294.pdf?src-supplier=RSComponents; ComponentLink1Description: https://datasheet.ciiva.com/11819/0900766b80f96399-11819294.pdf?src-supplier=RSComponents; ComponentLink2URL: https://datasheet.ciiva.com/7746/443971-7746285.pdf?src-supplier=Element14; ComponentLink2Description: https://datasheet.ciiva.com/7746/443971-7746285.pdf?src-supplier=Element14; ComponentLink3URL: https://datasheet.ciiva.com/7746/443971-7746284.pdf?src-supplier=Element14; ComponentLink3Description: https://datasheet.ciiva.com/7746/443971-7746284.pdf?src-supplier=Element14; Supplier Part Number 1: 311-1.50MHRCT-ND; LCSC Part Number: C137773
R48 = RC0402FR-07261KL: RES 261K OHM 1% 1/16W 0402; Manufacturer: Yageo; Item Type: Resistors; Voltage Rating (DC): 50V; Supplier: Avnet; Supplier Part Number: RC0402FR-07261KL; Manufacturer Part Number: RC0402FR-07261KL; RoHS: Yes; Stock: 30000; Pricing: 10000=0.00085 (USD); Lead Free: 5697LeadFree; ComponentLink1URL: https://datasheet.ciiva.com/8886/pyu-rc0402-51-rohs-l-6-8886524.pdf?src-supplier=Avnet; ComponentLink1Description: https://datasheet.ciiva.com/8886/pyu-rc0402-51-rohs-l-6-8886524.pdf?src-supplier=Avnet; ComponentLink2URL: https://datasheet.ciiva.com/17419/pyu-rc0402-51-rohs-l-6-r-17419487.pdf?src-supplier=Future+Electronics; ComponentLink2Description: https://datasheet.ciiva.com/17419/pyu-rc0402-51-rohs-l-6-r-17419487.pdf?src-supplier=Future+Electronics; LCSC Part Number: C185437
R50 = RC0402FR-072K49L: RES 2.49K OHM 1% 1/16W 0402; Manufacturer: Yageo; Item Type: Resistors; Value: 2.49kR; Temperature Coefficient: 100ppm/°C; Power Rating: 62.5mW; Voltage Rating: 50V; Max Power Dissipation: 63mW; Supplier: Future Electronics; Supplier Part Number: 7635139; Manufacturer Part Number: RC0402FR-072K49L; RoHS: Yes; Stock: 530000; Pricing: 10000=0.0012, 100000=0.0011, 300000=0.001, 750000=0.001, 2000000=0.0009 (USD); Case/Package: 0402; Case Code (Metric): 1005; Case Code (Imperial): 0402; Contact Plating: Tin,Lead; Min Operating Temperature: -55°C; Max Operating Temperature: 155°C; Tolerance: 1%; Resistor Type: Thick Film; Package Quantity: 1; Packaging: Tape and Reel; Number of Terminations: 2; Termination: SMD/SMT; Voltage Rating (DC): 50V; Features: Moisture Resistant; Series: RC; Resistance Tolerance: 1%; Length: 0.039inch; Width: 0.02inch; Height: 0.016inch; Reach SVHC Compliant: No; Lead Free: Lead Free; RoHS Compliant: Yes; ComponentLink1URL: https://datasheet.ciiva.com/2518/pyu-r-int-thick-7-2518986.pdf?src-supplier=Digikey; ComponentLink1Description: https://datasheet.ciiva.com/2518/pyu-r-int-thick-7-2518986.pdf?src-supplier=Digikey; ComponentLink2URL: https://datasheet.ciiva.com/2518/pyu-r-int-thick-7-2518987.pdf?src-supplier=Digikey; ComponentLink2Description: https://datasheet.ciiva.com/2518/pyu-r-int-thick-7-2518987.pdf?src-supplier=Digikey; ComponentLink3URL: https://datasheet.ciiva.com/7983/1018594-7983516.pdf?src-supplier=Element14; ComponentLink3Description: https://datasheet.ciiva.com/7983/1018594-7983516.pdf?src-supplier=Element14; ComponentLink4URL: https://datasheet.ciiva.com/2518/pyu-r-int-thick-7-2518985.pdf?src-supplier=Digikey; ComponentLink4Description: https://datasheet.ciiva.com/2518/pyu-r-int-thick-7-2518985.pdf?src-supplier=Digikey; ComponentLink5URL: https://datasheet.ciiva.com/5558/pyu-rc0402-51-rohs-l-6-r-5558122.pdf?src-supplier=Mouser; ComponentLink5Description: https://datasheet.ciiva.com/5558/pyu-rc0402-51-rohs-l-6-r-5558122.pdf?src-supplier=Mouser; LCSC Part Number: C145071
R51 = RC0402FR-070RL: RES 0 OHM JUMPER 1/16W 0402; Manufacturer: Yageo; Item Type: Resistors; Resistance: 0R; Tolerance: 1%; Power Rating: 62.5mW; Voltage Rating: 50V; Temperature Coefficient: 200ppm/°C; Max Power Dissipation: 63mW; Supplier 1: Mouser; Manufacturer Part Number: RC0402FR-070RL; RoHS: Yes; Stock 1: 8556842; Pricing 1: 1=0.10000, 10=0.01400, 50=0.01400, 100=0.00600, 1000=0.00300, 5000=0.00200, 10000=0.00100 (USD); Mount: Surface Mount; Case/Package: 0402; Contact Plating: Tin,Matte; Case Code (Imperial): 0402; Case Code (Metric): 1005; Size Code: 0402; Min Operating Temperature: -55°C; Max Operating Temperature: 155°C; Resistor Type: Thick Film; Packaging: Tape and Reel; Termination: SMD/SMT; Features: Moisture Resistant; Series: RC; Number of Terminations: 2; Length: 1mm; Width: 0.5mm; Height: 0.35mm; Radiation Hardening: No; Lead Free: Lead Free; RoHS Compliant: Yes; ComponentLink1URL: https://datasheet.ciiva.com/8896/pyu-rc0402-51-rohs-l-6-8896149.pdf?src-supplier=Avnet; ComponentLink1Description: https://datasheet.ciiva.com/8896/pyu-rc0402-51-rohs-l-6-8896149.pdf?src-supplier=Avnet; ComponentLink2URL: https://datasheet.ciiva.com/16790/pyu-rc0402-51-rohs-l-6-r-16790444.pdf?src-supplier=Future+Electronics; ComponentLink2Description: https://datasheet.ciiva.com/16790/pyu-rc0402-51-rohs-l-6-r-16790444.pdf?src-supplier=Future+Electronics; Supplier Part Number 1: 603-RC0402FR-070RL; LCSC Part Number: C106231
SWD1 = 0475890001: CONN RCPT MICRO USB AB R/A SMD; Manufacturer: Molex; Manufacturer Part Number: 47589-0001; Contact Resistance: 40mR; Current Rating: 1.8A; Gender: Female; Number of Contacts: 5; Supplier 1: Digi-Key; Supplier Part Number 1: WM17143CT-ND; Category: USB Connectors; Mount: Surface Mount,PCB; Orientation: Right Angle; Supplier Unit Price 1: $0.48114; ComponentLink1URL: https://datasheet.ciiva.com/16148/0475890001-io-connectors-16148921.pdf?src-supplier=Onlinecomponents.com; ComponentLink1Description: https://datasheet.ciiva.com/16148/0475890001-io-connectors-16148921.pdf?src-supplier=Onlinecomponents.com
TP1-TP5 = TEST POINT: Test Point ON; Item Type: TEST POINT
U1 = MCP1700T-3302E/TT: Voltage Regulator; LDO; SOT-23; PD 369.6mW; VO 3.3V; Regline +/-0.75%/V; Manufacturer: Microchip; Supplier 1: Digi-Key; Supplier Part Number 1: MCP1700T3302ETTCT-ND; Category: Voltage Regulators - Linear; Manufacturer Part Number: MCP1700T-3302E/TT; Supplier Unit Price 1: $0.28; ComponentLink1URL: https://datasheet.ciiva.com/2040/21826b-2040112.pdf?src-supplier=Digi-Key; ComponentLink1Description: https://datasheet.ciiva.com/2040/21826b-2040112.pdf?src-supplier=Digi-Key
U2 = RT9025-25GSP: High performance 2A ULDO linear regulator; Manufacturer: Richtek; Max Input Voltage: 5V; Dropout Voltage: 230mV; Case/Package: SOIC; Manufacturer Part Number: RT9025-25GSP; Max Output Current: 2A; Output Current: 2A; Supplier 1: Digi-Key; Supplier Part Number 1: 1028-1009-2-ND; Supplier Unit Price 1: $0.33814; Category: Voltage Regulators - Linear
U3 = W5500: Ethernet Controller 10/100 Base-T/TX PHY SPI Interface; Manufacturer: WIZnet; Max Supply Current: 132mA; Max Supply Voltage: 3.63V; Min Supply Voltage: 2.97V; SymbolName_1: W5500; LibraryName: WIZnet; DeviceSetName: W5500; Supplier 1: Digi-Key; Supplier Part Number 1: 1278-1021-ND; Case/Package: LQFP; Category: Integrated Circuits (ICs); Interface: SPI; Manufacturer Part Number: W5500
U4 = STM32L152RCT6: IC MCU 32BIT 512KB FLASH 64LQFP; Manufacturer: STMicroelectronics; Core Architecture: ARM; Frequency: 32MHz; RAM Size: 80KB; Max Supply Voltage: 3.6V; Min Supply Voltage: 1.8V; Case/Package: LQFP; Category: Microcontrollers; Manufacturer Part Number: STM32L151RET6; Memory Size: 512KB; Supplier 1: Digi-Key; Supplier Part Number 1: 497-17527-ND
U5 = MCU-M95M02-DRMN6TP(SOIC8): EEPROM Memory IC 2Mb _256K x 8_ SPI 5MHz 8-SO; Manufacturer: STMicroelectronics; Manufacturer Part Number: M95M02-DWMN3TP/K; ComponentLink1Description: Supplier; ComponentLink1URL: https://www.digikey.fr/product-detail/fr/stmicroelectronics/M95M04-DRMN6TP/497-M95M04-DRMN6TPDKR-ND/11482714; ComponentLink2Description: Datasheet; ComponentLink2URL: https://www.st.com/resource/en/datasheet/m95m04-dr.pdf; Case Code (Metric): SOIC-8; Memory Format: EEPROM; Memory Size: 2Mb; Supplier 1: Digi-Key; Supplier Part Number 1: 497-15597-2-ND; Supplier Unit Price 1: $2.15
U6 = LTC4041EUFD#PBF: IC BATT PWR MGMT MULTI 1C 24QFN; Manufacturer: Analog Devices / Linear Technology; Max Supply Voltage: 5.5V; Min Supply Voltage: 2.9V; Number of Cells: 2NUMBER; Number of Outputs: 1NUMBER; Output Current: 2.5A; Supplier: Mouser; LCSC Part Number: C3151895; Manufacturer Part Number: LTC4041EUFD#PBF; RoHS: Yes; Item Type: IC; Stock: 15485; Pricing: 1=9.86, 10=7.01, 50=6.22, 100=4.91, 1000=4.43, 10000=4.43 (USD); Pins: 24NUMBER; Min Operating Temperature: -40°C; Max Operating Temperature: 125°C; Height: 800um; ComponentLink1URL: http://www.analog.com/media/en/technical-documentation/data-sheets/LTC4041.pdf?src-supplier=Digikey; ComponentLink1Description: http://www.analog.com/media/en/technical-documentation/data-sheets/LTC4041.pdf?src-supplier=Digikey; ComponentLink2URL: https://datasheet.octopart.com/LTC4041EUFD%23PBF-Analog-Devices-datasheet-138896410.pdf?src-supplier=Element14; ComponentLink2Description: https://datasheet.octopart.com/LTC4041EUFD%23PBF-Analog-Devices-datasheet-138896410.pdf?src-supplier=Element14
X1 = XTAL: 8MHz ±30ppm Crystal 20pF 80 Ohms HC-49/US; Manufacturer: Fox Electronics; Manufacturer Part Number: FC4STCBMF8.0-BAG200; Supplier 1: Arrow; Supplier Part Number 1: FC4STCBMF8.0-BAG200; Supplier Unit Price 1: $0.2273
Y1 = XTAL3225: CRYSTAL 25.0000MHZ 8PF SMD; Manufacturer: Kyocera AVX; Manufacturer Part Number: CX3225CA25000D0HSSCC; ESR (Equivalent Series Resistance): 100R; Frequency Stability: 50ppm; Tolerance: 20ppm; ComponentLink1Description: Supplier; ComponentLink1URL: https://www.digikey.com/product-detail/en/kyocera-international-inc-electronic-components/CX3225CA25000D0HSSCC/1253-1142-1-ND/4453960; Supplier 1: Digi-Key; Supplier Part Number 1: 1253-1142-1-ND; Case/Package: SMD/SMT; Frequency: 25MHz; Load Capacitance: 8pF
Y2 = CM8V-T1A-32.768KHZ-9PF-20PPM-TA-QC: ABS25 Series 32.768 kHz Â±20 ppm 6 pF -40 to +85 Â°C SMT Low Frequency Crystal; Manufacturer Part Number: CM8V-T1A 32.768kHz 9pF +/-20ppm TA QC; Manufacturer: Micro Crystal; Frequency Tolerance: 20ppm; Load Capacitance: 9pF; Supplier 1: Digi-Key; Supplier Part Number 1: 2195-CM8V-T1A-32.768KHZ-9PF-20PPM-TA-QCCT-ND; Case/Package: SMD/SMT; Frequency: 32.768kHz; Length: 2mm; Supplier Unit Price 1: $0.66; Max Operating Temperature: 85°C; Min Operating Temperature: -40°C